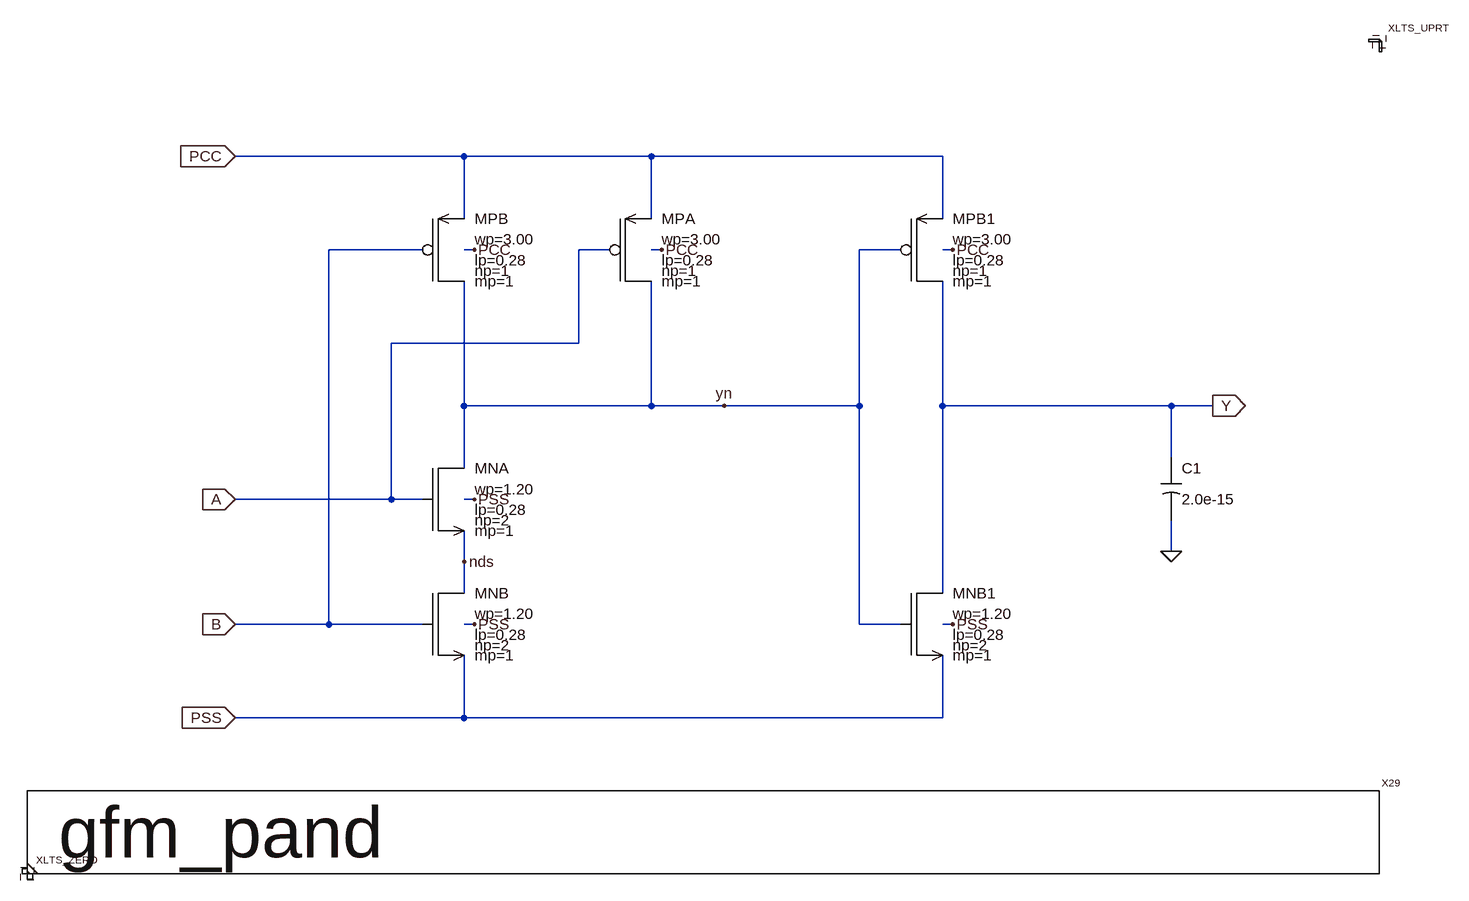
[diagram p0: schematic gfm_pand.asc]
gfm_pand.asc, the LTspice schematic file:
Version 4
SHEET 1 4552 4336
WIRE 672 -1104 320 -1104
WIRE 960 -1104 672 -1104
WIRE 1408 -1104 960 -1104
WIRE 672 -1008 672 -1104
WIRE 960 -1008 960 -1104
WIRE 1408 -1008 1408 -1104
WIRE 608 -960 464 -960
WIRE 688 -960 672 -960
WIRE 896 -960 848 -960
WIRE 976 -960 960 -960
WIRE 1344 -960 1280 -960
WIRE 1424 -960 1408 -960
WIRE 848 -816 848 -960
WIRE 848 -816 560 -816
WIRE 672 -720 672 -912
WIRE 960 -720 960 -912
WIRE 960 -720 672 -720
WIRE 1072 -720 960 -720
WIRE 1280 -720 1280 -960
WIRE 1280 -720 1072 -720
WIRE 1408 -720 1408 -912
WIRE 1760 -720 1408 -720
WIRE 1824 -720 1760 -720
WIRE 1760 -640 1760 -720
WIRE 672 -624 672 -720
WIRE 560 -576 560 -816
WIRE 560 -576 320 -576
WIRE 608 -576 560 -576
WIRE 688 -576 672 -576
WIRE 1760 -496 1760 -544
WIRE 672 -480 672 -528
WIRE 672 -432 672 -480
WIRE 1408 -432 1408 -720
WIRE 464 -384 464 -960
WIRE 464 -384 320 -384
WIRE 608 -384 464 -384
WIRE 688 -384 672 -384
WIRE 1280 -384 1280 -720
WIRE 1344 -384 1280 -384
WIRE 1424 -384 1408 -384
WIRE 672 -240 672 -336
WIRE 672 -240 320 -240
WIRE 1408 -240 1408 -336
WIRE 1408 -240 672 -240
FLAG 320 -240 PSS
IOPIN 320 -240 In
FLAG 320 -384 B
IOPIN 320 -384 In
FLAG 320 -576 A
IOPIN 320 -576 In
FLAG 320 -1104 PCC
IOPIN 320 -1104 In
FLAG 1824 -720 Y
IOPIN 1824 -720 Out
FLAG 1760 -496 0
FLAG 688 -384 PSS
FLAG 976 -960 PCC
FLAG 688 -960 PCC
FLAG 688 -576 PSS
FLAG 672 -480 nds
FLAG 1424 -384 PSS
FLAG 1424 -960 PCC
FLAG 1072 -720 yn
SYMBOL BD_GTitleLTS 0 0 R0
SYMATTR InstName X29
SYMATTR SpiceModel gfm_pand
SYMBOL gfmcu_pmos3p3 896 -960 R0
SYMATTR InstName MPA
SYMATTR Value wp=3.00
SYMATTR Value2 lp=0.28
SYMBOL gfmcu_pmos3p3 608 -960 R0
SYMATTR InstName MPB
SYMATTR Value wp=3.00
SYMATTR Value2 lp=0.28
SYMBOL gfmcu_nmos3p3 608 -576 R0
SYMATTR InstName MNA
SYMATTR SpiceLine np=2
SYMATTR Value wp=1.20
SYMATTR Value2 lp=0.28
SYMBOL gfmcu_nmos3p3 608 -384 R0
SYMATTR InstName MNB
SYMATTR SpiceLine np=2
SYMATTR Value wp=1.20
SYMATTR Value2 lp=0.28
SYMBOL gcap 1760 -640 R0
SYMATTR InstName C1
SYMATTR Value 2.0e-15
SYMBOL gfmcu_pmos3p3 1344 -960 R0
SYMATTR InstName MPB1
SYMATTR Value wp=3.00
SYMATTR Value2 lp=0.28
SYMBOL gfmcu_nmos3p3 1344 -384 R0
SYMATTR InstName MNB1
SYMATTR SpiceLine np=2
SYMATTR Value wp=1.20
SYMATTR Value2 lp=0.28
SYMBOL BD_ZERO 0 0 R0
SYMATTR InstName XLTS_ZERO
SYMBOL BD_UPRT 2080 -1280 R0
SYMATTR InstName XLTS_UPRT

The netlist it stands for:
* gfm_pand.asc
XX29 BD_GTitleLTS
XMPA yn A PCC PCC gfmcu_pmos3p3 wp=3.00 lp=0.28 np=1 mp=1  ; pins ND NG NS NB
XMPB yn B PCC PCC gfmcu_pmos3p3 wp=3.00 lp=0.28 np=1 mp=1  ; pins ND NG NS NB
XMNA yn A nds PSS gfmcu_nmos3p3 wp=1.20 lp=0.28 np=2 mp=1  ; pins ND NG NS NB
XMNB nds B PSS PSS gfmcu_nmos3p3 wp=1.20 lp=0.28 np=2 mp=1  ; pins ND NG NS NB
C1 Y 0 2.0e-15
XMPB1 Y yn PCC PCC gfmcu_pmos3p3 wp=3.00 lp=0.28 np=1 mp=1  ; pins ND NG NS NB
XMNB1 Y yn PSS PSS gfmcu_nmos3p3 wp=1.20 lp=0.28 np=2 mp=1  ; pins ND NG NS NB
XXLTS_ZERO BD_ZERO
XXLTS_UPRT BD_UPRT
.lib models_gfmcu.lib
.lib dmodels_analog.lib
.backanno
.end